# EAGLE design esp (EAGLE 9.6.0)

## Sheet 1 of 3
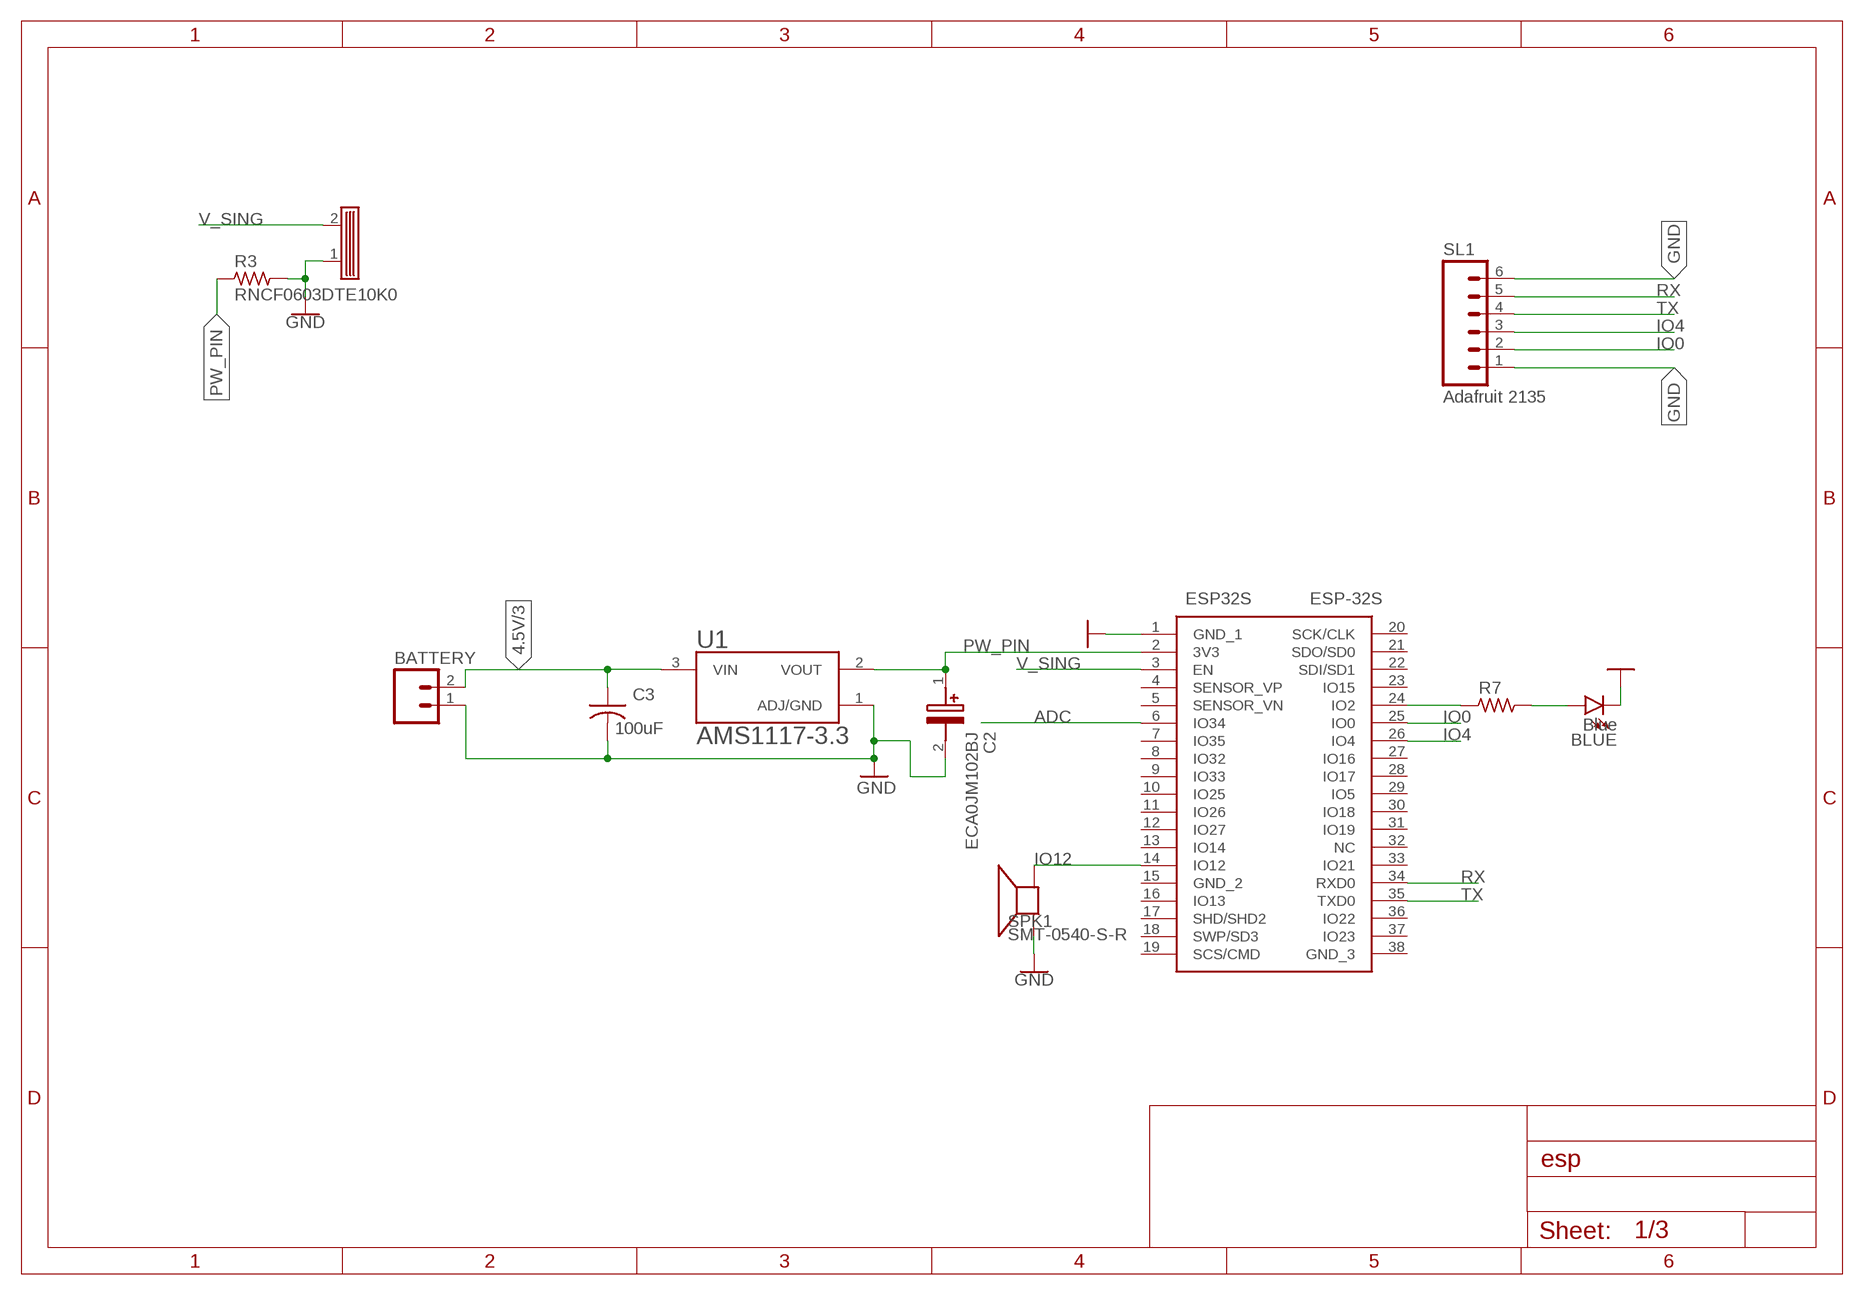
[diagram p0: schematic, sheet 1]

### Parts
BATTERY  MP-4-3 TAKACHI ELECTRONICS ENCLOSURE TAKACHI ELECTRONICS ENCLOSURE  M02  [02P]
BLUE  Blue  LED3MM  [LED3MM]
C2  ECA0JM102BJ  [CAPPRD350W65D825H1250]
C3  100uF  C-USC0805K  [C0805K]
ESP32S  ESP-32S  [ESP-32S]
R3  RNCF0603DTE10K0  R_0603  [R0603]
R7  ERJ-UP3J221V  R_0201  [R0201]
SL1  Adafruit 2135  M06  [06P]
SPK1  SMT-0540-S-R  [SMT-0540-S-R]
U1  AMS1117-3.3  [SOT229P700X180-4N]
U$1  SW-18015P  [SW-18015P]

### Nets
4.5V: BATTERY.2 C3.1 U1.3(VIN) ; also sheet 2,3
4.5V1: ESP32S.24(IO2) R7.1
ADC: ESP32S.6(IO34) ; also sheet 2
GND: BATTERY.1 BLUE.K(C) C2.2(-) C3.2 ESP32S.1(GND_1) R3.2 SL1.1 SL1.6 SPK1.-(+) U1.1(ADJ/GND) U$1.1(+VE) ; also sheet 2,3
IO0: ESP32S.25(IO0) SL1.2
IO4: ESP32S.26(IO4) SL1.3
IO12: ESP32S.14(IO12) SPK1.+(-)
N$4: BLUE.A R7.2
PW_PIN: C2.1(+) ESP32S.2(3V3) R3.1 U1.2(VOUT)
RX: ESP32S.34(RXD0) SL1.5
TX: ESP32S.35(TXD0) SL1.4
V_SING: ESP32S.3(EN) U$1.2(-VE)
Unconnected: ESP32S.4(SENSOR_VP) ESP32S.5(SENSOR_VN) ESP32S.7(IO35) ESP32S.8(IO32) ESP32S.9(IO33) ESP32S.10(IO25) ESP32S.11(IO26) ESP32S.12(IO27) ESP32S.13(IO14) ESP32S.15(GND_2) ESP32S.16(IO13) ESP32S.17(SHD/SHD2) ESP32S.18(SWP/SD3) ESP32S.19(SCS/CMD) ESP32S.20(SCK/CLK) ESP32S.21(SDO/SD0) ESP32S.22(SDI/SD1) ESP32S.23(IO15) ESP32S.27(IO16) ESP32S.28(IO17) ESP32S.29(IO5) ESP32S.30(IO18) ESP32S.31(IO19) ESP32S.32(NC) ESP32S.33(IO21) ESP32S.36(IO22) ESP32S.37(IO23) ESP32S.38(GND_3)

## Sheet 2 of 3
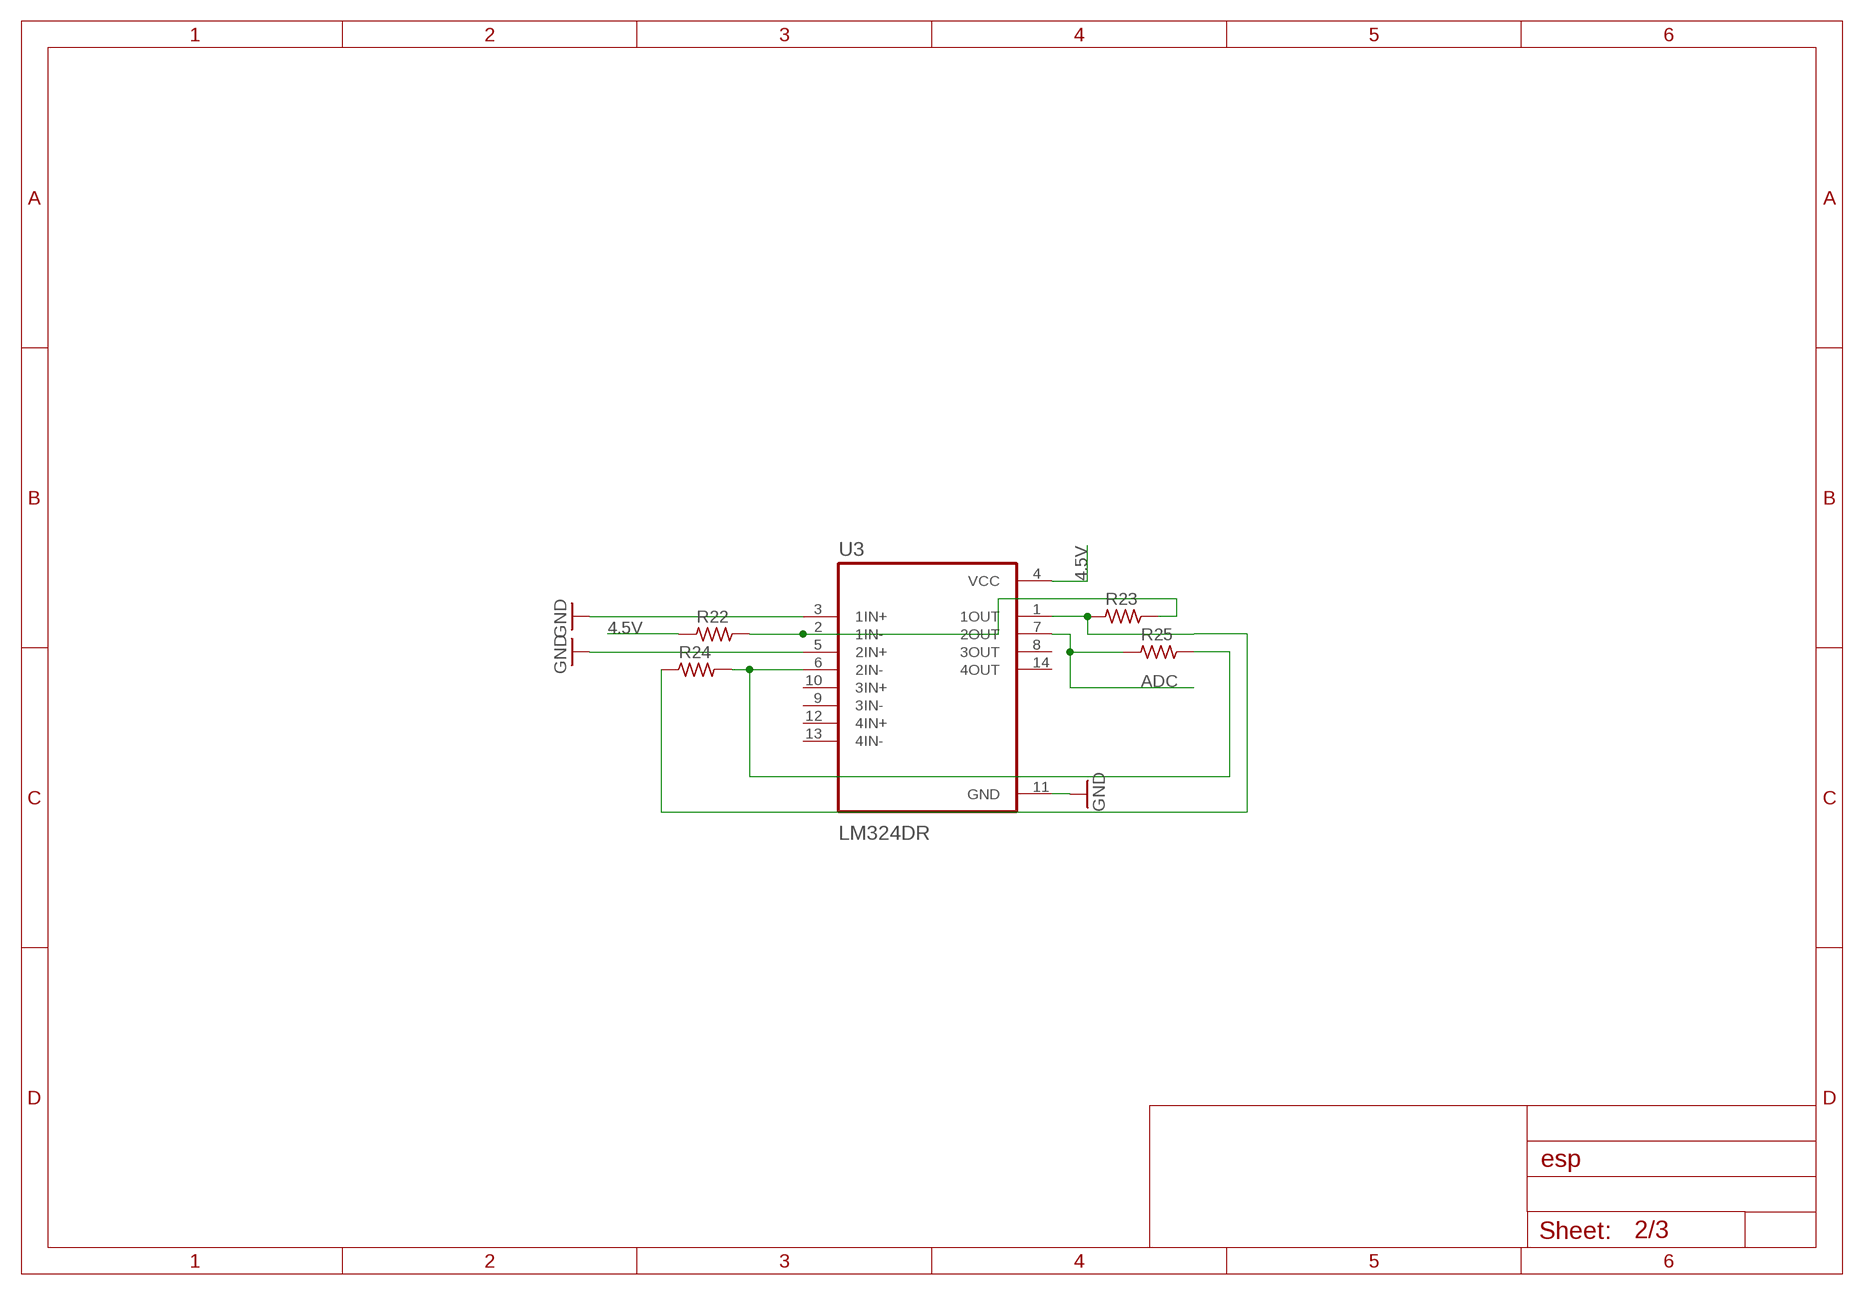
[diagram p1: schematic, sheet 2]

### Parts
R22  RMCF0201JT6K20  R_0201  [R0201]
R23  RC0201JR-0710KL  R_0201  [R0201]
R24  RC0201JR-0710KL  R_0201  [R0201]
R25  RC0201JR-0710KL  R_0201  [R0201]
U3  LM324DR  [SOIC127P600X175-14N]

### Nets
4.5V: R22.1 U3.4(VCC) ; also sheet 1,3
ADC: R25.1 U3.7(2OUT) ; also sheet 1
GND: U3.3(1IN+) U3.5(2IN+) U3.11(GND) ; also sheet 1,3
N$20: R22.2 R23.2 U3.2(1IN-)
N$21: R24.2 R25.2 U3.6(2IN-)
N$22: R23.1 R24.1 U3.1(1OUT)
Unconnected: U3.8(3OUT) U3.9(3IN-) U3.10(3IN+) U3.12(4IN+) U3.13(4IN-) U3.14(4OUT)

## Sheet 3 of 3
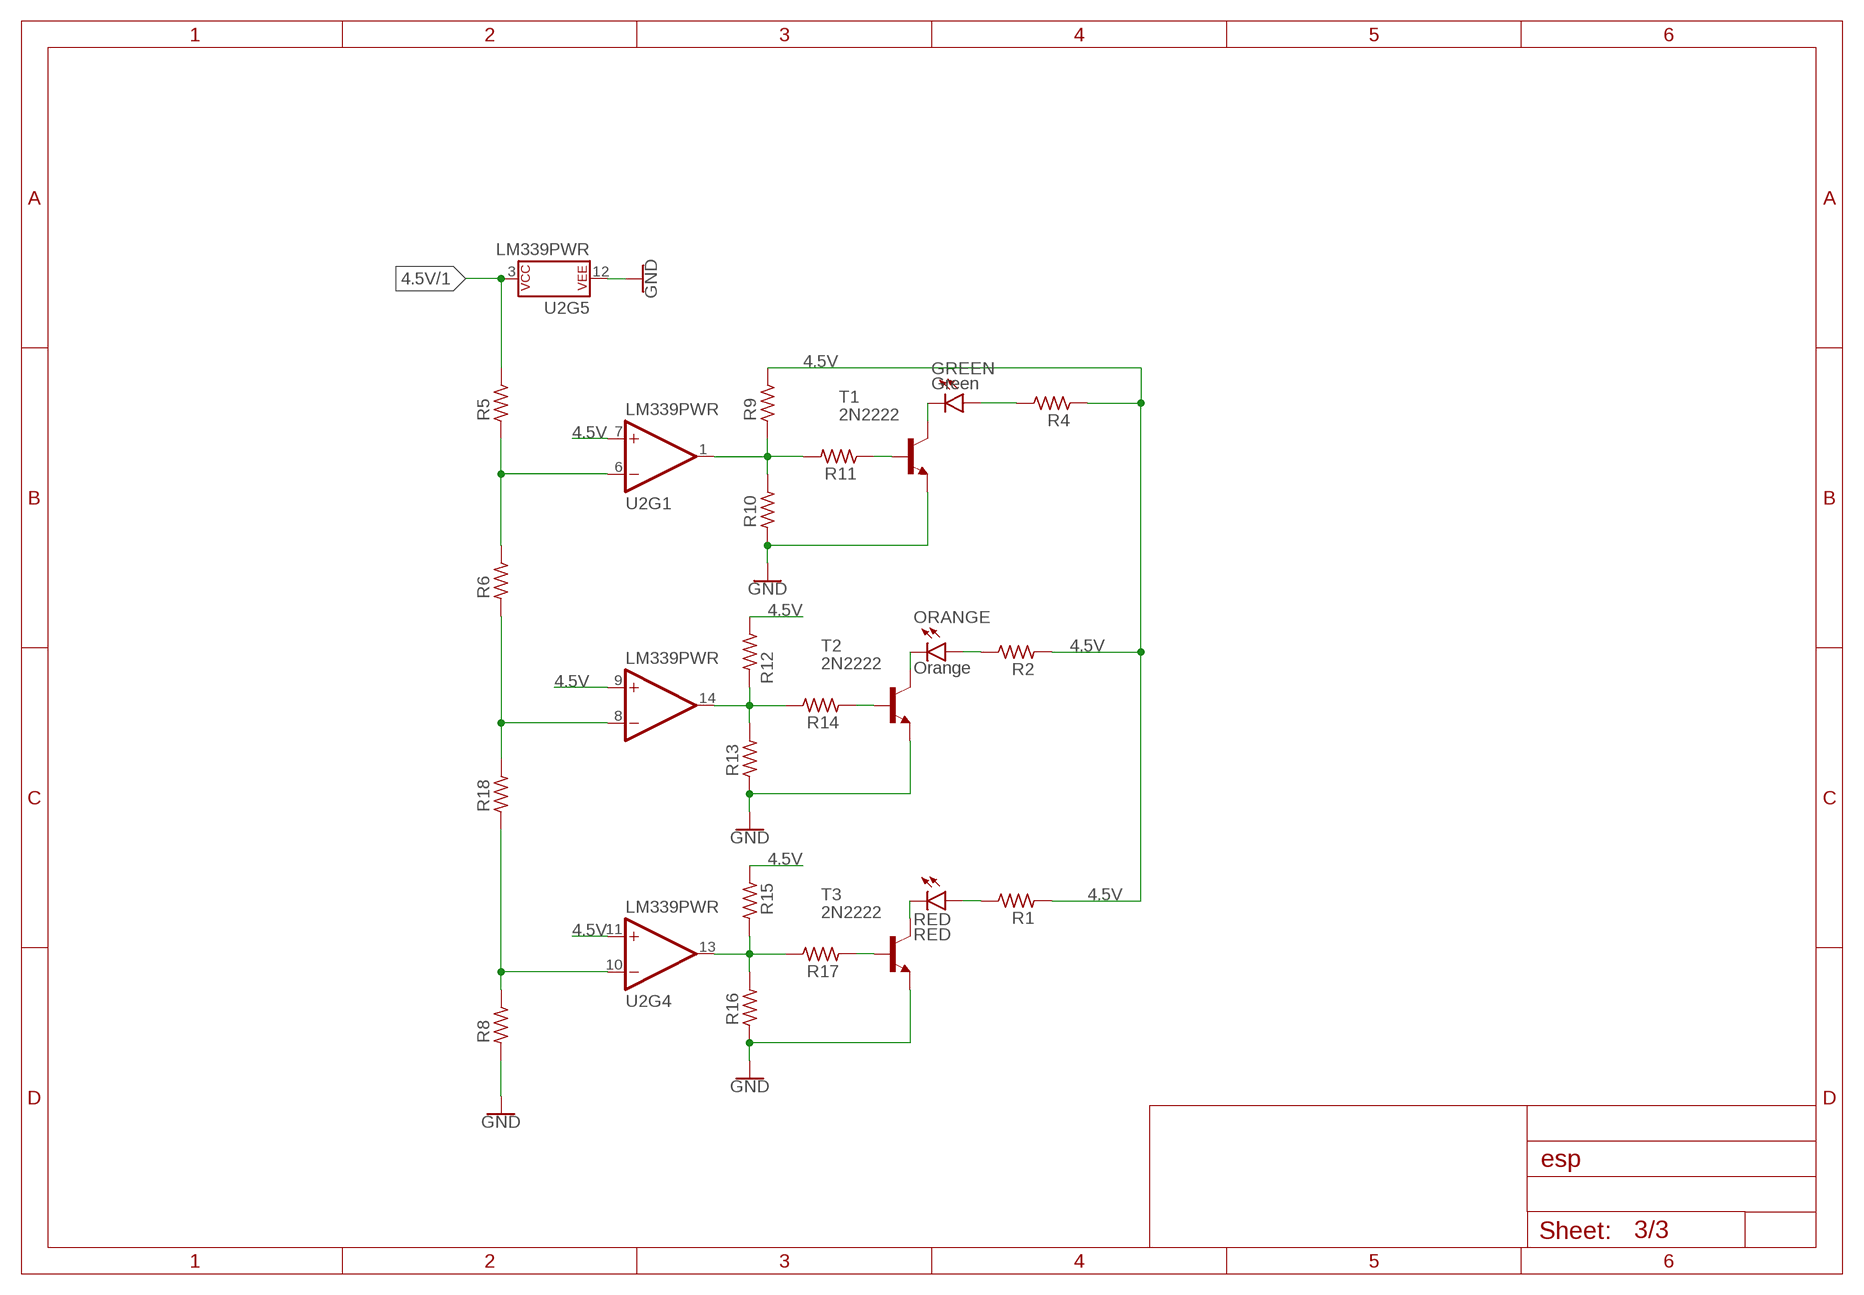
[diagram p2: schematic, sheet 3]

### Parts
GREEN  Green  LED3MM  [LED3MM]
ORANGE  Orange  LED3MM  [LED3MM]
R1  ERJ-UP3J221V  R_0201  [R0201]
R2  ERJ-UP3J221V  R_0201  [R0201]
R4  ERJ-UP3J221V  R_0201  [R0201]
R5  RMCF0201JT10K0  R_0201  [R0201]
R6  RMCF0201JT20K0  R_0201  [R0201]
R8  RMCF0201JT10K0  R_0201  [R0201]
R9  RMCF0201JT10K0  R_0201  [R0201]
R10  RMCF0201JT10K0  R_0201  [R0201]
R11  RMCF0201JT10K0  R_0201  [R0201]
R12  RMCF0201JT10K0  R_0201  [R0201]
R13  RMCF0201JT10K0  R_0201  [R0201]
R14  RMCF0201JT10K0  R_0201  [R0201]
R15  RMCF0201JT10K0  R_0201  [R0201]
R16  RMCF0201JT10K0  R_0201  [R0201]
R17  RMCF0201JT10K0  R_0201  [R0201]
R18  PNM0805E5002BST5  R_0805  [C0805]
RED  RED  LED3MM  [LED3MM]
T1  2N2222  [TO92-EBC-OVAL]
T2  2N2222  [TO92-EBC-OVAL]
T3  2N2222  [TO92-EBC-OVAL]
U2  LM339PWR  LM339  [TSSOP-14]

### Nets
4.5V: R1.1 R2.1 R4.1 R5.2 R9.2 R12.1 R15.1 U2.3(P$V+) U2.7(+IN) U2.9(+IN) U2.11(+IN) ; also sheet 1,2
GND: R8.1 R10.1 R13.1 R16.1 T1.E T2.E T3.E U2.12(P$V-) ; also sheet 1,2
N$1: GREEN.A R4.2
N$2: ORANGE.A R2.2
N$3: R1.2 RED.A
N$5: R8.2 R18.1 U2.10(-IN)
N$6: R6.1 R18.2 U2.8(-IN)
N$7: R5.1 R6.2 U2.6(-IN)
N$8: R9.1 R10.2 R11.2 U2.1(OUT)
N$9: R12.2 R13.2 R14.2 U2.14(OUT)
N$10: R15.2 R16.2 R17.2 U2.13(OUT)
N$11: R11.1 T1.B
N$12: R14.1 T2.B
N$13: R17.1 T3.B
N$14: GREEN.K(C) T1.C
N$15: ORANGE.K(C) T2.C
N$16: RED.K(C) T3.C
Unconnected: U2.2(OUT) U2.4(-IN) U2.5(+IN)

## Library data of the parts
BATTERY = con-amp-quick:M02: AMP QUICK CONNECTOR; OC_FARNELL: unknown; OC_NEWARK: unknown
BLUE GREEN ORANGE RED = led:LED: LED OSRAM: - CHIPLED LG R971, LG N971, LY N971, LG Q971, LY Q971, LO R971, LY R971 LH N974, LH R974 LS Q976, LO Q976, LY Q976 LO Q996 - Hyper CHIPLED LW Q18S LB Q993, LB Q99A, LB R99A - SideLED LS A670, LO A670, LY A670, LG A670, LP A670 LB A673, LV A673, LT A673, LW A673 LH A674 LY A675 LS A676, LA A676, LO A676, LY A676, LW A676 LS A679, LY A679, LG A679 - Hyper Micro SIDELED® LS Y876, LA Y876, LO Y876, LY Y876 LT Y87S - SmartLED LW L88C, LW L88S LB L89C, LB L89S, LG L890 LS L89K, LO L89K, LY L89K LS L896, LA L896, LO L896, LY L896 - TOPLED LS T670, LO T670, LY T670, LG T670, LP T670 LSG T670, LSP T670, LSY T670, LOP T670, LYG T670 LG T671, LOG T671, LSG T671 LB T673, LV T673, LT T673, LW T673 LH T674 LS T676, LA T676, LO T676, LY T676, LB T676, LH T676, LSB T676, LW T676 LB T67C, LV T67C, LT T67C, LS T67K, LO T67K, LY T67K, LW E67C LS E67B, LA E67B, LO E67B, LY E67B, LB E67C, LV E67C, LT E67C LW T67C LS T679, LY T679, LG T679 LS T770, LO T770, LY T770, LG T770, LP T770 LB T773, LV T773, LT T773, LW T773 LH T774 LS E675, LA E675, LY E675, LS T675 LS T776, LA T776, LO T776, LY T776, LB T776 LHGB T686 LT T68C, LB T68C - Hyper Mini TOPLED® LB M676 - Mini TOPLED Santana® LG M470 LS M47K, LO M47K, LY M47K Source: http://www.osram.convergy.de LUXEON: - LUMILED® LXK2-PW12-R00, LXK2-PW12-S00, LXK2-PW14-U00, LXK2-PW14-V00 LXK2-PM12-R00, LXK2-PM12-S00, LXK2-PM14-U00 LXK2-PE12-Q00, LXK2-PE12-R00, LXK2-PE12-S00, LXK2-PE14-T00, LXK2-PE14-U00 LXK2-PB12-K00, LXK2-PB12-L00, LXK2-PB12-M00, LXK2-PB14-N00, LXK2-PB14-P00, LXK2-PB14-Q00 LXK2-PR12-L00, LXK2-PR12-M00, LXK2-PR14-Q00, LXK2-PR14-R00 LXK2-PD12-Q00, LXK2-PD12-R00, LXK2-PD12-S00 LXK2-PH12-R00, LXK2-PH12-S00 LXK2-PL12-P00, LXK2-PL12-Q00, LXK2-PL12-R00 Source: www.luxeon.com KINGBRIGHT: KA-3528ASYC Source: www.kingbright.com
C2 = ECA0JM102BJ:ECA0JM102BJ: Cap Aluminum Lytic 1000uF 6.3V 20% (8 X 11.5mm) Radial 580mA 2000h 85C Source: Datasheet <https://www.arrow.com/en/products/eca-0jm102bj/panasonic>; ARROW_PART_NUMBER: ECA0JM102BJ; ARROW_PRICE-STOCK: https://www.arrow.com/en/products/eca-0jm102bj/panasonic; DESCRIPTION: Cap Aluminum Lytic 1000uF 6.3V 20% (8 X 11.5mm) Radial 580mA 2000h 85C; HEIGHT: 12.5mm; MANUFACTURER_NAME: Panasonic; MANUFACTURER_PART_NUMBER: ECA0JM102BJ
C3 = rcl:C-US: CAPACITOR, American symbol
ESP32S = ESP-32s:ESP-32S: WiFi-BT-BLE MCU module Source: Datasheet <http://en.ai-thinker.com/esp32/spec/esp32s>; DESCRIPTION: WiFi-BT-BLE MCU module; HEIGHT: mm; MANUFACTURER_NAME: Ai-Thinker; MANUFACTURER_PART_NUMBER: ESP-32s
R1 R2 R4-R17 R22-R25 = rc-master-smd:R_: RESISTOR
R3 R18 = rc-master-smd (2):R_: RESISTOR
SL1 = con-amp-quick:M06: AMP QUICK CONNECTOR; OC_FARNELL: unknown; OC_NEWARK: unknown
SPK1 = adafruit:SMT-0540-S-R: SMT-0549-S-R Small surface-mount magnetic buzzer
T1-T3 = adafruit:2N2222: NPN TRANSISTOR Big oval pads
U1 = AMS1117-3.3 (2):AMS1117-3.3: Sot223/Pkg 1-Amp 3.3-Volt Low Drop Out Voltage Regulatator; AVAILABILITY: Unavailable; DESCRIPTION: LDO Voltage Regulators 800MA LDO LINEAR REG; MF: AMD; MP: AMS1117-3.3; PACKAGE: None; PRICE: None
U2 = SparkFun-IC-Amplifiers:LM339: Quad Comparator - LM339PWR Based on information from the SLCS006N datasheet from TI (www.ti.com). Created by nick@scantool.net, 2008. Updated 2016. SparkFun Products SparkFun OBD-II UART <https://www.sparkfun.com/products/9555> (WIG-09555) SparkFun Car Diagnostics Kit <https://www.sparkfun.com/products/10769> (RTL-10769); PROD_ID: IC-09990
U3 = LM324DR:LM324DR: Check prices <https://pricing.snapeda.com/parts/LM324DR/Texas%20Instruments/view-part?ref=eda>; AVAILABILITY: Good; DESCRIPTION: 4-Channel industry standard operational amplifier 14-SOIC 0 to 70; MF: Texas Instruments; MP: LM324DR; PACKAGE: SOIC-14 Texas Instruments; PRICE: None; PURCHASE-URL: https://pricing.snapeda.com/search/part/LM324DR/?ref=eda
U$1 = SW-18015P:SW-18015P

## Board
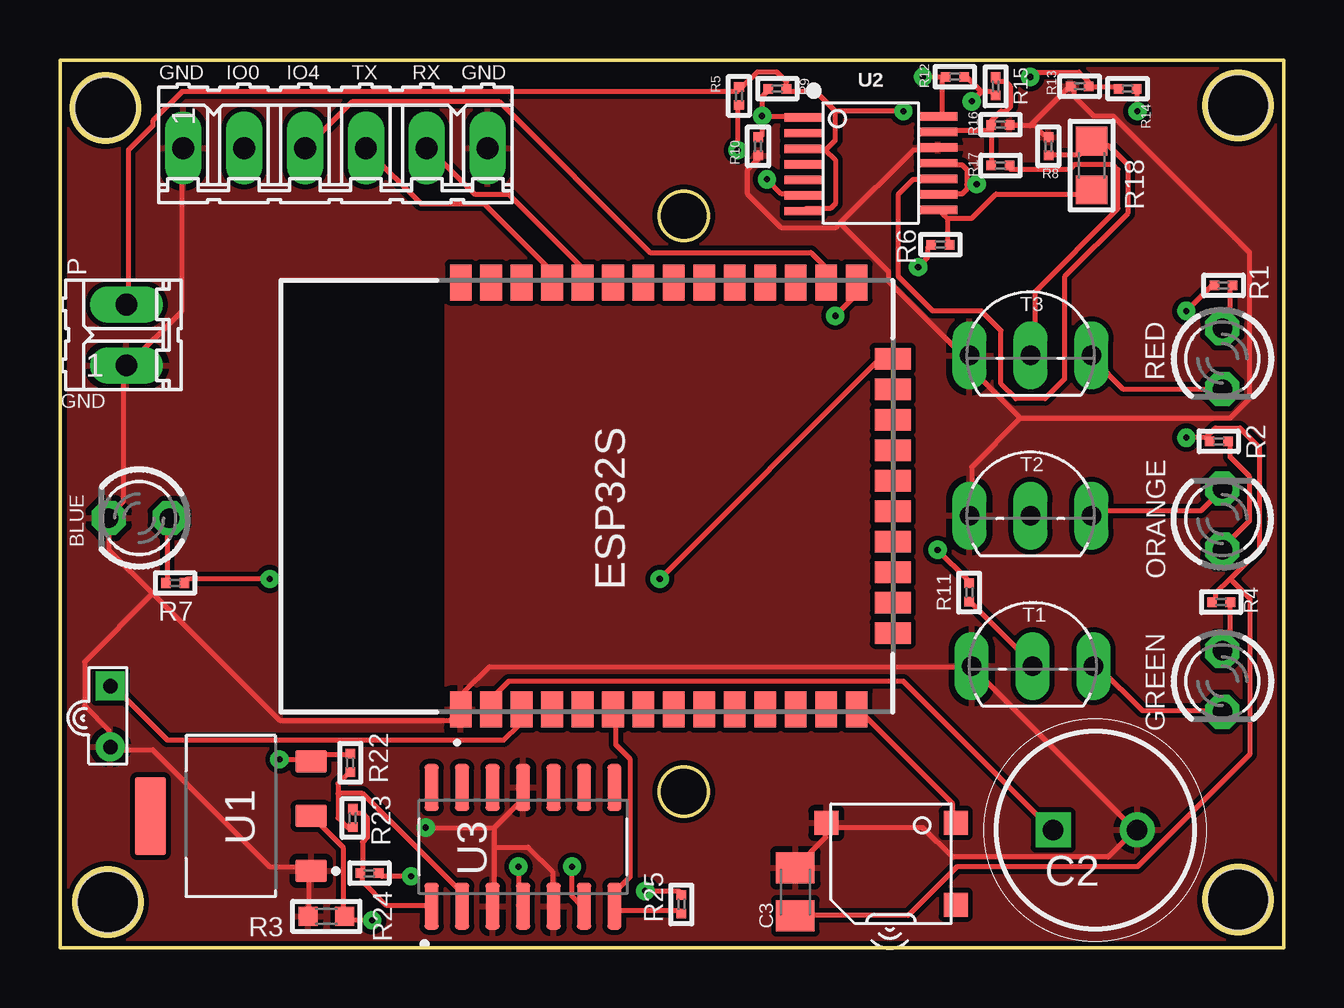
[diagram p3: board, top side]
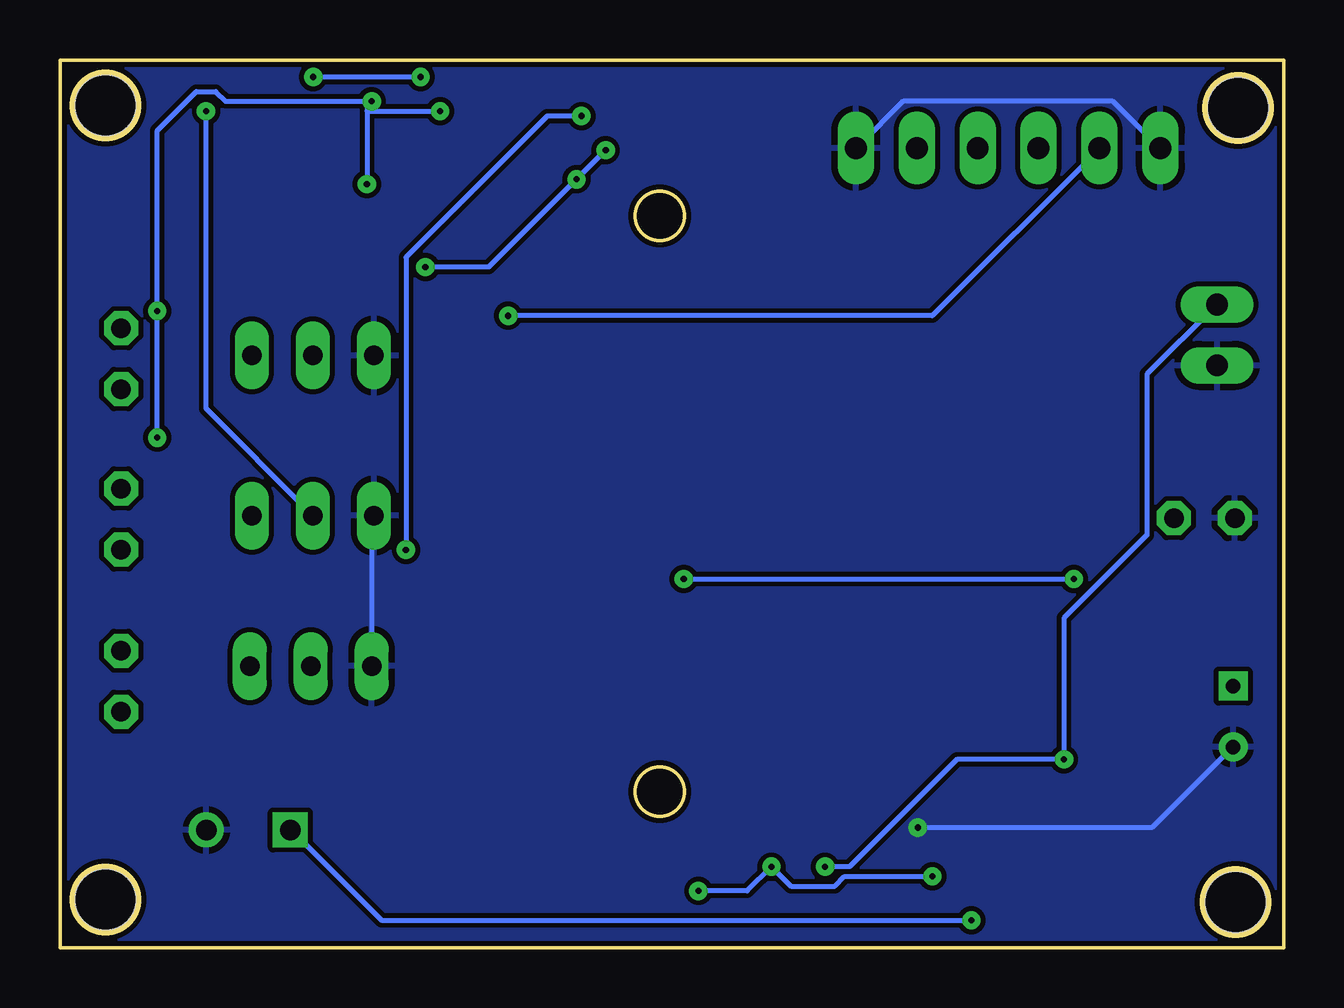
[diagram p4: board, bottom side, seen from below]

Size 51 x 37 mm. Coordinates in mm from the lower left corner, seen from the top.
Outline: 0,37 0,0 51,0 51,37 0,37
Outline: circle at 26,6.5 radius 1.02
Outline: circle at 26,30.5 radius 1.02
Outline: circle at 1.9,35 radius 1.39
Outline: circle at 49.1,35.1 radius 1.39
Outline: circle at 49.1,2 radius 1.39
Outline: circle at 2,1.9 radius 1.39
Copper layers (1*16): Top 0.035mm / dielectric 1.5mm / Bottom 0.035mm
Design rules "default *": minimum track width 8mil, minimum drill 10mil, track to track 8mil, track to pad 10mil, pad to pad 10mil, via to via 10mil, smd to smd 8mil, copper to edge 8mil, drill to drill 8mil, minimum pad ring 12mil, minimum via ring 10mil, stop-mask expansion 4mil, vias tented up to drill 25mil, thermal gap 10mil
Holes 2 mm at 26,30.5 26,6.5
Holes 2.6 mm at 1.9,35 2,1.9 49.1,2 49.1,35.1
tRestrict: area 9.3,9.6 to 16,27.8

### Footprints (pad centres in the part's own frame; a part is rotated, then mirrored left to right if it is on the bottom)
02P = drill 0.914 long: 1 -1.27,0; 2 1.27,0
LED3MM = drill 0.813 octagon: A -1.27,0; K 1.27,0
CAPPRD350W65D825H1250 = drill 0.85 pad 1.275 square: 1 0,0 | drill 0.85 pad 1.275: 2 3.5,0
C0805K = smd 1.3 x 1.6: 1 -1,0; 2 1,0
ESP-32S = smd 1.5 x 0.9: 1 -8.9,18.01; 2 -8.9,16.74; 3 -8.9,15.47; 4 -8.9,14.2; 5 -8.9,12.93; 6 -8.9,11.66; 7 -8.9,10.39; 8 -8.9,9.12; 9 -8.9,7.85; 10 -8.9,6.58; 11 -8.9,5.31; 12 -8.9,4.04; 13 -8.9,2.77; 14 -8.9,1.5; 25 8.9,1.5; 26 8.9,2.77; 27 8.9,4.04; 28 8.9,5.31; 29 8.9,6.58; 30 8.9,7.85; 31 8.9,9.12; 32 8.9,10.39; 33 8.9,11.66; 34 8.9,12.93; 35 8.9,14.2; 36 8.9,15.47; 37 8.9,16.74; 38 8.9,18.01 | smd 0.9 x 1.5: 15 -5.71,0; 16 -4.44,0; 17 -3.17,0; 18 -1.9,0; 19 -0.63,0; 20 0.64,0; 21 1.91,0; 22 3.18,0; 23 4.45,0; 24 5.72,0
R0201 = smd 0.4 x 0.4: 1 -0.381,0; 2 0.381,0
R0603 = smd 0.8 x 0.8: 1 -0.762,0; 2 0.762,0
C0805 = smd 1.2 x 1.3: 1 -1.016,0; 2 1.016,0
06P = drill 0.914 long: 1 -6.35,0; 2 -3.81,0; 3 -1.27,0; 4 1.27,0; 5 3.81,0; 6 6.35,0
SMT-0540-S-R = smd 1 x 1: + 1.7,-2.7; - 1.7,2.7; M -1.7,-2.7
TO92-EBC-OVAL = drill 0.813 long: B 0,-1.27; C 2.54,-1.27; E -2.54,-1.27
SOT229P700X180-4N = smd 0.93 x 1.31: 1 -2.29,-3.345; 2 0,-3.345; 3 2.29,-3.345 | smd 3.24 x 1.31: 4 0,3.345
TSSOP-14 = smd 1.6 x 0.35: 1 -2.8,1.9; 2 -2.8,1.25; 3 -2.8,0.6; 4 -2.8,-0.05; 5 -2.8,-0.7; 6 -2.8,-1.35; 7 -2.8,-2; 8 2.8,-1.95; 9 2.8,-1.3; 10 2.8,-0.65; 11 2.8,0; 12 2.8,0.65; 13 2.8,1.3; 14 2.8,1.95
SOIC127P600X175-14N = smd 1.97 x 0.6: 1 -2.475,3.81; 2 -2.475,2.54; 3 -2.475,1.27; 4 -2.475,0; 5 -2.475,-1.27; 6 -2.475,-2.54; 7 -2.475,-3.81; 8 2.475,-3.81; 9 2.475,-2.54; 10 2.475,-1.27; 11 2.475,0; 12 2.475,1.27; 13 2.475,2.54; 14 2.475,3.81
SW-18015P = drill 0.6: 1 0,0 | drill 0.6 square: 2 2.54,0

### Placement (x,y rotation side)
BATTERY  2.77,25.54 90 top
BLUE  3.3,17.9 180 top
C2  41.4,4.9 0 top
C3  30.65,2.32 90 top
ESP32S  34.71,18.82 90 top
GREEN  48.45,11.1 270 top
ORANGE  48.45,17.86 90 top
R1  48.5,27.6 0 top
R2  48.3,21.1 0 top
R3  11.1,1.3 180 top
R4  48.4,14.4 0 top
R5  28.3,35.5 90 top
R6  36.7,29.3 180 top
R7  4.8,15.2 180 top
R8  41.2,33.4 270 top
R9  29.9,35.8 0 top
R10  29.1,33.4 90 top
R11  37.9,14.8 90 top
R12  37.3,36.3 180 top
R13  42.5,35.9 0 top
R14  44.5,35.8 180 top
R15  39,35.9 90 top
R16  39.2,34.3 180 top
R17  39.2,32.6 180 top
R18  43,32.6 270 top
R22  12.1,7.7 270 top
R23  12.2,5.4 270 top
R24  12.9,3.1 0 top
R25  25.9,1.8 90 top
RED  48.45,24.55 270 top
SL1  11.48,33.33 0 top
SPK1  34.64,3.49 90 top
T1  40.55,13 0 top
T2  40.45,19.27 0 top
T3  40.45,25.95 0 top
U1  7.12,5.48 90 top
U2  33.8,32.7 0 top
U3  19.3,4.2 90 top
U$1  2.1,8.36 90 top

### Tracks (layer width: path | path; a pad name or v marks a point on that pad's centre or on a via)
4.5V  (via drill 0.25)
  Top 0.203: R22.1 11.99,8.05 10.78,8.05 10.57,7.84 U1.3 10.37,7.84 v9.15,7.84 | v19.11,3.37 19.11,1.75 U3.4 | 32.32,34.87 31.5,35.68 30.28,35.68 R9.2 30.28,35.88 30.28,36.09 29.88,36.49 29.06,36.49 28.45,35.88 R5.2 28.25,35.68 5.09,35.68 3.87,34.46 3.87,34.26 2.85,33.24 2.85,26.94 BATTERY.2 | 32.32,34.87 32.32,33.65 31.91,33.24 | 31.91,33.24 31.1,33.24 U2.3 | 31.91,33.24 32.32,32.84 32.32,31.01 32.11,30.8 31.1,30.8 U2.7 | 37.8,31.82 37.8,32.43 37.6,32.63 36.79,32.63 U2.11 | 37.8,31.82 37.8,31.62 37.6,31.41 36.79,31.41 U2.9 | 38.41,35.68 37.8,36.29 R12.1 | 38.41,35.68 38.82,35.68 R15.1 | 48.77,15.36 49.99,16.58 49.99,20.85 49.18,21.66 48.16,21.66 47.76,21.25 | 48.77,15.36 48.16,14.75 48.16,14.55 R4.1 | 47.76,21.25 R2.1 47.76,21.25 | v46.95,26.54 47.96,27.55 R1.1 | 47.76,21.25 v46.95,21.25 | v38.01,35.27 38.41,35.68 | 48.77,15.36 49.59,14.55 49.59,8.05 44.91,3.37 37.4,3.37 35.36,1.34 30.69,1.34 C3.1 | v38.21,31.82 37.8,31.82 | v35.16,34.87 32.32,34.87
  Bottom 0.203: BATTERY.2 2.85,26.74 5.7,23.9 5.7,17.19 9.15,13.74 v9.15,7.84 13.62,7.84 18.09,3.37 v19.11,3.37 | v46.95,21.25 v46.95,26.54 46.95,34.06 45.32,35.68 44.51,35.68 44.1,35.27 38.21,35.27 | 38.21,35.27 v38.01,35.27 38.21,35.27 | 38.21,35.27 38.21,34.87 | 38.21,34.87 v38.21,31.82 | 38.21,34.87 v35.16,34.87
4.5V1  (via drill 0.25)
  Top 0.203: v8.74,15.36 5.29,15.36 R7.1 | v25,15.36 34.14,24.51 34.55,24.51 ESP32S.24
  Bottom 0.203: v25,15.36 v8.74,15.36
ADC
  Top 0.203: R25.1 25.81,1.54 23.17,1.54 U3.7 23.17,1.75 23.17,2.36 23.78,2.97 23.78,7.84 23.17,8.45 23.17,9.88 ESP32S.6
GND  (via drill 0.25)
  Top 0.203: C3.2 30.69,3.37 31.91,4.59 31.91,5 SPK1.- 32.11,5 35.97,5 37.19,3.78 43.69,3.78 44.71,4.79 C2.2 44.71,5 38.01,11.7 | 32.52,30.2 35.57,33.24 36.58,33.24 U2.12 | 32.52,30.2 32.32,29.99 30.08,29.99 28.66,31.41 28.66,32.43 29.06,32.84 R10.1 | 40.44,34.26 40.65,34.26 41.05,33.85 R8.1 | 40.44,34.26 39.63,34.26 R16.1 | 40.44,34.26 42.07,35.88 R13.1 42.27,35.88 42.27,35.48 43.09,34.67 43.9,34.67 49.59,28.98 49.59,22.88 48.77,22.07 40.04,22.07 | 40.04,22.07 38.01,24.1 38.01,24.51 T3.E 37.8,24.51 34.55,27.76 34.55,28.16 32.52,30.2 | 40.04,22.07 38.01,20.04 38.01,18.21 T2.E | 38.01,11.7 T1.E 38.01,11.7 | 18.09,5 18.09,4.19 | 18.09,4.19 18.09,1.75 U3.3 | 18.09,5 19.11,6.01 19.11,6.62 U3.11 | 18.09,4.19 19.51,4.19 20.53,3.17 20.53,1.75 U3.5 | R3.2 10.37,1.34 10.37,3.17 U1.1 10.37,3.37 8.74,3.37 3.87,8.25 2.24,8.25 U$1.1 2.04,8.45 2.04,9.06 1.02,10.08 1.02,11.91 3.87,14.75 | v15.25,5 18.09,5 | 3.87,14.75 2.04,16.58 2.04,17.8 BLUE.K 2.04,18 2.65,18.61 2.65,24.1 BATTERY.1 2.85,24.3 5.09,26.54 5.09,33.24 SL1.1 | 3.87,14.75 9.15,9.47 16.26,9.47 16.67,9.88 ESP32S.1 16.87,10.08 16.87,10.69 17.89,11.7 38.01,11.7
  Bottom 0.203: T1.E 38.01,11.91 38.01,18 T2.E | v15.25,5 5.49,5 2.24,8.25 U$1.1 | SL1.6 17.69,33.45 15.86,35.27 7.12,35.27 5.29,33.45 SL1.1
  pour Top: -2.5,39.8 52.2,39.8 52.2,-4.5 -2.5,-4.5
  pour Bottom: -2.5,39.8 52.2,39.8 52.2,-4.5 -2.5,-4.5
IO0  (via drill 0.25)
  Top 0.203: v32.32,26.33 33.13,27.15 33.13,27.55 ESP32S.25
  Bottom 0.203: v32.32,26.33 14.64,26.33 7.73,33.24 SL1.2
IO4
  Top 0.203: ESP32S.26 31.91,27.76 31.91,28.37 31.3,28.98 24.59,28.98 18.29,35.27 12.2,35.27 10.37,33.45 SL1.3
IO12
  Top 0.203: SPK1.+ 37.19,5.2 37.19,6.01 33.33,9.88 ESP32S.14
N$1
  Top 0.203: R4.2 48.77,14.35 48.77,12.72 48.57,12.52 GREEN.A
N$2
  Top 0.203: R2.2 48.77,21.05 48.77,20.44 49.59,19.63 49.59,17.8 48.57,16.78 ORANGE.A
N$3
  Top 0.203: R1.2 48.77,27.55 48.77,26.13 48.57,25.93 RED.A
N$4
  Top 0.203: R7.2 4.48,15.36 4.48,17.8 BLUE.A
N$5
  Top 0.203: R8.2 41.26,33.04 42.48,33.04 42.88,33.45 R18.1 43.09,33.45 43.69,33.45 44.51,32.63 44.51,30.6 41.87,27.96 41.87,23.69 41.05,22.88 39.83,22.88 39.22,23.49 39.22,25.73 38.41,26.54 36.38,26.54 34.96,27.96 34.96,31.41 35.57,32.02 36.58,32.02 U2.10
N$6
  Top 0.203: 36.99,30.4 36.99,29.38 R6.1 | 36.99,30.4 36.79,30.6 U2.8 | 36.99,30.4 38.01,30.4 39.02,31.41 42.88,31.41 R18.2
N$7  (via drill 0.25)
  Top 0.203: v28.25,33.24 28.25,35.07 R5.1 | v29.47,32.02 30.08,31.41 30.89,31.41 U2.6 | v35.77,28.37 36.18,28.77 36.18,29.18 R6.2
  Bottom 0.203: v28.25,33.24 v29.47,32.02 33.13,28.37 v35.77,28.37
N$8  (via drill 0.25)
  Top 0.203: v29.27,34.67 29.27,35.48 29.47,35.68 R9.1 | v29.27,34.67 29.27,33.85 R10.2 | v36.58,16.58 37.8,15.36 R11.2 | v29.27,34.67 30.89,34.67 U2.1
  Bottom 0.203: v36.58,16.58 36.58,28.77 30.69,34.67 v29.27,34.67
N$9  (via drill 0.25)
  Top 0.203: R14.2 44.1,35.88 42.88,35.88 R13.2 42.88,36.09 42.48,36.49 40.65,36.49 v40.44,36.29 | 36.79,36.29 36.79,34.67 U2.14 | 36.79,36.29 R12.2 36.79,36.29 | 36.79,36.29 v35.97,36.29
  Bottom 0.203: v35.97,36.29 v40.44,36.29
N$10
  Top 0.203: 38.82,34.06 38.82,34.26 R16.2 38.82,34.46 39.22,34.87 39.43,34.87 39.63,35.07 39.63,35.88 39.43,36.09 39.02,36.09 R15.2 | 38.82,34.06 38.82,32.63 R17.2 | 38.82,34.06 36.79,34.06 U2.13
N$11
  Top 0.203: R11.1 38.01,14.35 40.44,11.91 T1.B
N$12  (via drill 0.25)
  Top 0.203: v44.91,34.87 44.91,35.68 R14.1
  Bottom 0.203: v44.91,34.87 44.91,22.47 40.65,18.21 T2.B
N$13
  Top 0.203: R17.1 39.63,32.43 42.07,32.43 42.27,32.63 43.9,32.63 44.1,32.43 44.1,30.8 40.65,27.35 40.65,24.71 T3.B
N$14
  Top 0.203: GREEN.K 48.37,9.88 45.12,9.88 43.29,11.7 T1.C
N$15
  Top 0.203: T2.C 43.09,18.21 47.55,18.21 48.37,19.02 ORANGE.K
N$16
  Top 0.203: RED.K 48.37,23.29 44.3,23.29 43.09,24.51 T3.C
N$20
  Top 0.203: 11.59,6.42 11.59,6.83 11.99,7.23 R22.2 | 11.59,6.42 11.59,5.41 11.99,5 12.2,5 R23.2 | 11.59,6.42 12.61,6.42 16.67,2.36 16.67,1.75 U3.2
N$21  (via drill 0.25)
  Top 0.203: v14.64,2.97 13.42,2.97 R24.2 | v21.34,3.37 21.34,2.15 21.75,1.75 U3.6 | v24.39,2.36 25.81,2.36 R25.2
  Bottom 0.203: v14.64,2.97 18.29,2.97 18.7,2.56 20.53,2.56 v21.34,3.37 22.36,2.36 v24.39,2.36
N$22
  Top 0.203: R23.1 12.2,5.61 12.61,5.61 12.81,5.41 12.81,4.59 12.61,4.39 12.61,3.17 R24.1 12.61,2.97 12.61,2.76 13.62,1.75 15.45,1.75 U3.1
PW_PIN  (via drill 0.25)
  Top 0.203: U1.2 10.57,5.41 11.79,4.19 11.79,1.34 R3.1 11.99,1.14 v13.01,1.14 | ESP32S.2 18.09,10.08 18.09,10.49 18.7,11.09 35.16,11.09 41.26,5 C2.1
  Bottom 0.203: v13.01,1.14 37.6,1.14 41.26,4.79 C2.1
RX
  Top 0.203: ESP32S.34 21.75,27.76 21.75,28.37 18.7,31.41 17.28,31.41 15.45,33.24 SL1.5
TX
  Top 0.203: ESP32S.35 20.33,27.76 20.33,28.37 17.69,31.01 15.04,31.01 12.81,33.24 SL1.4
V_SING
  Top 0.203: ESP32S.3 19.11,9.88 19.11,9.27 18.5,8.66 4.48,8.66 2.24,10.89 U$1.2

### Text on the board
tPlace: GND | IO0 | IO4 | TX | RX | GND | P | GND